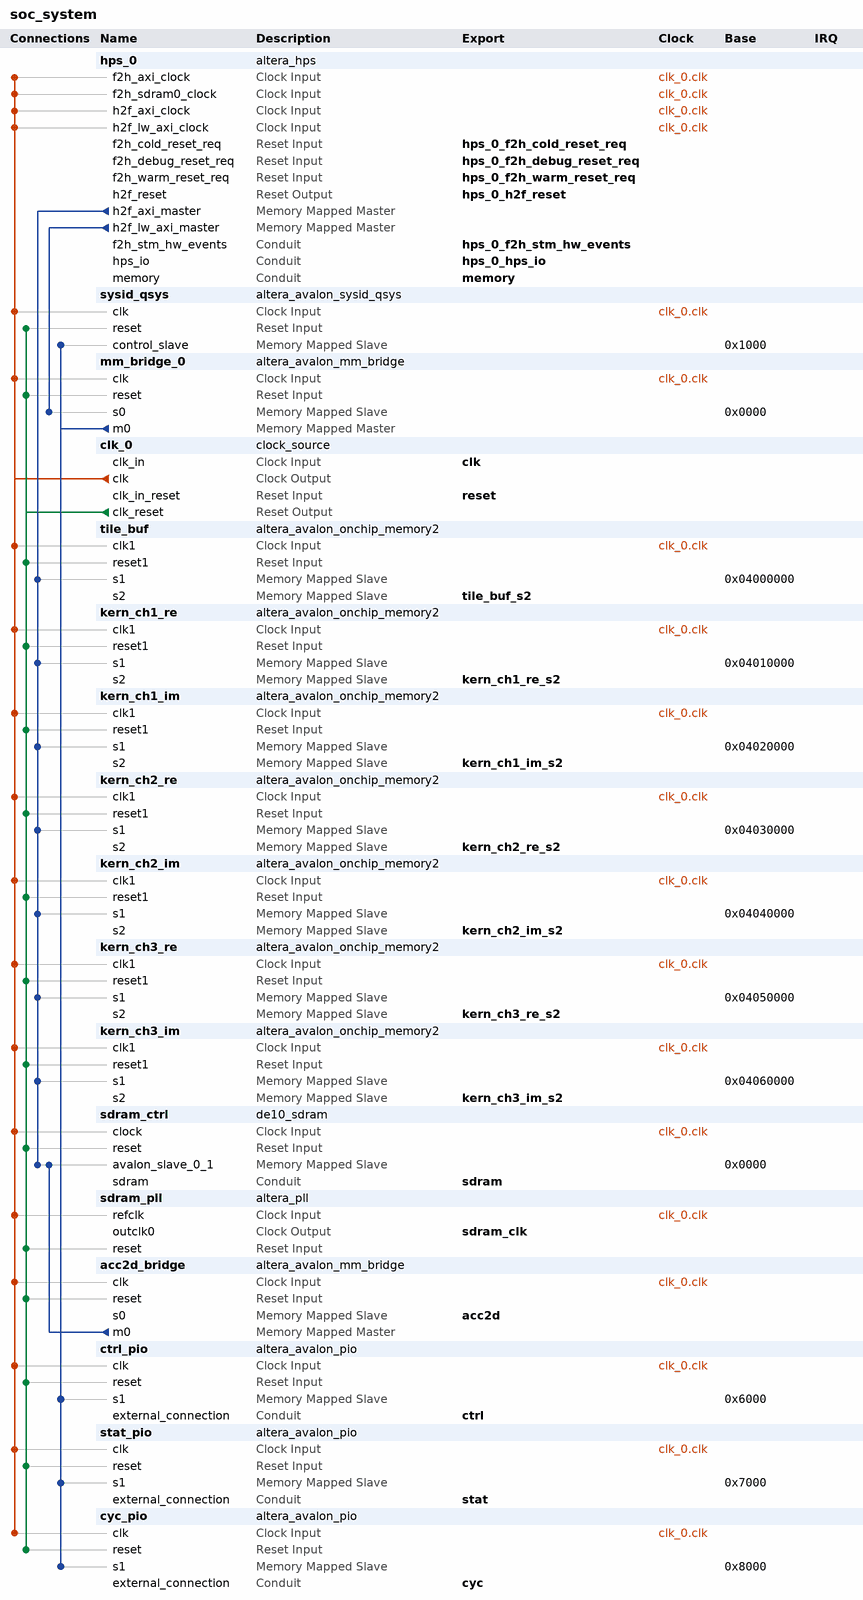
[diagram p0: system contents]
# Platform Designer (Qsys) system soc_system, Cyclone V 5CSXFC6D6F31C6
# Parameters at their usual value, and those the tool derives, are not listed.
package require -exact qsys 25.1
create_system soc_system
set_project_property DEVICE_FAMILY {Cyclone V}
set_project_property DEVICE 5CSXFC6D6F31C6

add_instance hps_0 altera_hps 25.1
set_instance_parameter_value hps_0 EMAC1_Mode RGMII
set_instance_parameter_value hps_0 EMAC1_PinMuxing {HPS I/O Set 0}
set_instance_parameter_value hps_0 F2SCLK_COLDRST_Enable true
set_instance_parameter_value hps_0 F2SCLK_DBGRST_Enable true
set_instance_parameter_value hps_0 F2SCLK_WARMRST_Enable true
set_instance_parameter_value hps_0 F2SDRAM_Type {Avalon-MM Bidirectional}
set_instance_parameter_value hps_0 F2SDRAM_Width 256
set_instance_parameter_value hps_0 F2SINTERRUPT_Enable true
set_instance_parameter_value hps_0 F2S_Width 2
set_instance_parameter_value hps_0 FPGA_PERIPHERAL_OUTPUT_CLOCK_FREQ_EMAC0_GTX_CLK 100
set_instance_parameter_value hps_0 FPGA_PERIPHERAL_OUTPUT_CLOCK_FREQ_EMAC0_MD_CLK 100.0
set_instance_parameter_value hps_0 FPGA_PERIPHERAL_OUTPUT_CLOCK_FREQ_EMAC1_GTX_CLK 100
set_instance_parameter_value hps_0 FPGA_PERIPHERAL_OUTPUT_CLOCK_FREQ_EMAC1_MD_CLK 100.0
set_instance_parameter_value hps_0 HPS_PROTOCOL DDR3
set_instance_parameter_value hps_0 I2C0_Mode I2C
set_instance_parameter_value hps_0 I2C0_PinMuxing {HPS I/O Set 0}
set_instance_parameter_value hps_0 I2C1_Mode I2C
set_instance_parameter_value hps_0 I2C1_PinMuxing {HPS I/O Set 0}
set_instance_parameter_value hps_0 LWH2F_Enable true
set_instance_parameter_value hps_0 MEM_BANKADDR_WIDTH 3
set_instance_parameter_value hps_0 MEM_CLK_FREQ 400.0
set_instance_parameter_value hps_0 MEM_COL_ADDR_WIDTH 10
set_instance_parameter_value hps_0 MEM_DQ_WIDTH 32
set_instance_parameter_value hps_0 MEM_DRV_STR RZQ/6
set_instance_parameter_value hps_0 MEM_ROW_ADDR_WIDTH 15
set_instance_parameter_value hps_0 MEM_RTT_NOM RZQ/6
set_instance_parameter_value hps_0 MEM_RTT_WR {Dynamic ODT off}
set_instance_parameter_value hps_0 MEM_TCL 11
set_instance_parameter_value hps_0 MEM_TFAW_NS 45.0
set_instance_parameter_value hps_0 MEM_TRAS_NS 35.0
set_instance_parameter_value hps_0 MEM_TRCD_NS 13.75
set_instance_parameter_value hps_0 MEM_TRFC_NS 260.0
set_instance_parameter_value hps_0 MEM_TRP_NS 13.75
set_instance_parameter_value hps_0 MEM_VENDOR Micron
set_instance_parameter_value hps_0 MEM_WTCL 7
set_instance_parameter_value hps_0 QSPI_Mode {1 SS}
set_instance_parameter_value hps_0 QSPI_PinMuxing {HPS I/O Set 0}
set_instance_parameter_value hps_0 REF_CLK_FREQ 25.0
set_instance_parameter_value hps_0 S2FCLK_USER2CLK 5
set_instance_parameter_value hps_0 S2F_Width 2
set_instance_parameter_value hps_0 SDIO_Mode {4-bit Data}
set_instance_parameter_value hps_0 SDIO_PinMuxing {HPS I/O Set 0}
set_instance_parameter_value hps_0 SPIM0_Mode {Single Slave Select}
set_instance_parameter_value hps_0 SPIM0_PinMuxing {HPS I/O Set 0}
set_instance_parameter_value hps_0 SPIM1_Mode {Single Slave Select}
set_instance_parameter_value hps_0 SPIM1_PinMuxing {HPS I/O Set 0}
set_instance_parameter_value hps_0 STM_Enable true
set_instance_parameter_value hps_0 TIMING_BOARD_AC_SKEW 0.02
set_instance_parameter_value hps_0 TIMING_BOARD_AC_TO_CK_SKEW 0.01
set_instance_parameter_value hps_0 TIMING_BOARD_DQ_TO_DQS_SKEW 0.05
set_instance_parameter_value hps_0 TIMING_BOARD_MAX_CK_DELAY 0.03
set_instance_parameter_value hps_0 TIMING_BOARD_MAX_DQS_DELAY 0.02
set_instance_parameter_value hps_0 TIMING_BOARD_SKEW_BETWEEN_DQS 0.06
set_instance_parameter_value hps_0 TIMING_BOARD_SKEW_CKDQS_DIMM_MAX 0.12
set_instance_parameter_value hps_0 TIMING_BOARD_SKEW_CKDQS_DIMM_MIN 0.06
set_instance_parameter_value hps_0 TIMING_BOARD_SKEW_WITHIN_DQS 0.01
set_instance_parameter_value hps_0 TIMING_TDH 65
set_instance_parameter_value hps_0 TIMING_TDQSCK 255
set_instance_parameter_value hps_0 TIMING_TDQSQ 125
set_instance_parameter_value hps_0 TIMING_TDS 30
set_instance_parameter_value hps_0 TIMING_TIH 140
set_instance_parameter_value hps_0 TIMING_TIS 190
set_instance_parameter_value hps_0 TIMING_TQSH 0.4
set_instance_parameter_value hps_0 UART0_Mode {No Flow Control}
set_instance_parameter_value hps_0 UART0_PinMuxing {HPS I/O Set 0}
set_instance_parameter_value hps_0 USB1_Mode SDR
set_instance_parameter_value hps_0 USB1_PinMuxing {HPS I/O Set 0}
set_instance_parameter_value hps_0 desired_cfg_clk_mhz 100.0
set_instance_parameter_value hps_0 desired_qspi_clk_mhz 400.0

add_instance sysid_qsys altera_avalon_sysid_qsys 25.1
set_instance_parameter_value sysid_qsys id -1395322110

add_instance mm_bridge_0 altera_avalon_mm_bridge 25.1
set_instance_parameter_value mm_bridge_0 ADDRESS_UNITS SYMBOLS
set_instance_parameter_value mm_bridge_0 ADDRESS_WIDTH 10
set_instance_parameter_value mm_bridge_0 DATA_WIDTH 32
set_instance_parameter_value mm_bridge_0 MAX_PENDING_RESPONSES 4
set_instance_parameter_value mm_bridge_0 USE_AUTO_ADDRESS_WIDTH 1

add_instance clk_0 clock_source 25.1
set_instance_parameter_value clk_0 clockFrequency 50000000

add_instance tile_buf altera_avalon_onchip_memory2 25.1
set_instance_parameter_value tile_buf dataWidth 8
set_instance_parameter_value tile_buf dualPort true
set_instance_parameter_value tile_buf initMemContent false
set_instance_parameter_value tile_buf initializationFileName onchip_mem.hex
set_instance_parameter_value tile_buf memorySize 12288
set_instance_parameter_value tile_buf singleClockOperation true

add_instance kern_ch1_re altera_avalon_onchip_memory2 25.1
set_instance_parameter_value kern_ch1_re dataWidth 16
set_instance_parameter_value kern_ch1_re dualPort true
set_instance_parameter_value kern_ch1_re initMemContent false
set_instance_parameter_value kern_ch1_re initializationFileName onchip_mem.hex
set_instance_parameter_value kern_ch1_re memorySize 33280
set_instance_parameter_value kern_ch1_re singleClockOperation true

add_instance kern_ch1_im altera_avalon_onchip_memory2 25.1
set_instance_parameter_value kern_ch1_im dataWidth 16
set_instance_parameter_value kern_ch1_im dualPort true
set_instance_parameter_value kern_ch1_im initMemContent false
set_instance_parameter_value kern_ch1_im initializationFileName onchip_mem.hex
set_instance_parameter_value kern_ch1_im memorySize 33280
set_instance_parameter_value kern_ch1_im singleClockOperation true

add_instance kern_ch2_re altera_avalon_onchip_memory2 25.1
set_instance_parameter_value kern_ch2_re dataWidth 16
set_instance_parameter_value kern_ch2_re dualPort true
set_instance_parameter_value kern_ch2_re initMemContent false
set_instance_parameter_value kern_ch2_re initializationFileName onchip_mem.hex
set_instance_parameter_value kern_ch2_re memorySize 33280
set_instance_parameter_value kern_ch2_re singleClockOperation true

add_instance kern_ch2_im altera_avalon_onchip_memory2 25.1
set_instance_parameter_value kern_ch2_im dataWidth 16
set_instance_parameter_value kern_ch2_im dualPort true
set_instance_parameter_value kern_ch2_im initMemContent false
set_instance_parameter_value kern_ch2_im initializationFileName onchip_mem.hex
set_instance_parameter_value kern_ch2_im memorySize 33280
set_instance_parameter_value kern_ch2_im singleClockOperation true

add_instance kern_ch3_re altera_avalon_onchip_memory2 25.1
set_instance_parameter_value kern_ch3_re dataWidth 16
set_instance_parameter_value kern_ch3_re dualPort true
set_instance_parameter_value kern_ch3_re initMemContent false
set_instance_parameter_value kern_ch3_re initializationFileName onchip_mem.hex
set_instance_parameter_value kern_ch3_re memorySize 33280
set_instance_parameter_value kern_ch3_re singleClockOperation true

add_instance kern_ch3_im altera_avalon_onchip_memory2 25.1
set_instance_parameter_value kern_ch3_im dataWidth 16
set_instance_parameter_value kern_ch3_im dualPort true
set_instance_parameter_value kern_ch3_im initMemContent false
set_instance_parameter_value kern_ch3_im initializationFileName onchip_mem.hex
set_instance_parameter_value kern_ch3_im memorySize 33280
set_instance_parameter_value kern_ch3_im singleClockOperation true

add_instance sdram_ctrl de10_sdram 1.0

add_instance sdram_pll altera_pll 25.1
set_instance_parameter_value sdram_pll gui_device_speed_grade 1
set_instance_parameter_value sdram_pll gui_number_of_clocks 1
set_instance_parameter_value sdram_pll gui_operation_mode direct
set_instance_parameter_value sdram_pll gui_output_clock_frequency0 50.0
set_instance_parameter_value sdram_pll gui_phase_shift0 -3750
set_instance_parameter_value sdram_pll gui_pll_mode {Integer-N PLL}
set_instance_parameter_value sdram_pll gui_reference_clock_frequency 50.0
set_instance_parameter_value sdram_pll gui_use_locked false

add_instance acc2d_bridge altera_avalon_mm_bridge 25.1
set_instance_parameter_value acc2d_bridge ADDRESS_UNITS SYMBOLS
set_instance_parameter_value acc2d_bridge ADDRESS_WIDTH 26
set_instance_parameter_value acc2d_bridge DATA_WIDTH 32
set_instance_parameter_value acc2d_bridge MAX_PENDING_RESPONSES 4
set_instance_parameter_value acc2d_bridge USE_AUTO_ADDRESS_WIDTH 0

add_instance ctrl_pio altera_avalon_pio 25.1
set_instance_parameter_value ctrl_pio direction Output
set_instance_parameter_value ctrl_pio width 1

add_instance stat_pio altera_avalon_pio 25.1
set_instance_parameter_value stat_pio bitClearingEdgeCapReg true
set_instance_parameter_value stat_pio captureEdge true
set_instance_parameter_value stat_pio direction Input
set_instance_parameter_value stat_pio width 2

add_instance cyc_pio altera_avalon_pio 25.1
set_instance_parameter_value cyc_pio direction Input
set_instance_parameter_value cyc_pio width 32

# connections
add_connection clk_0.clk acc2d_bridge.clk clock
add_connection clk_0.clk ctrl_pio.clk clock
add_connection clk_0.clk cyc_pio.clk clock
add_connection clk_0.clk hps_0.f2h_axi_clock clock
add_connection clk_0.clk hps_0.f2h_sdram0_clock clock
add_connection clk_0.clk hps_0.h2f_axi_clock clock
add_connection clk_0.clk hps_0.h2f_lw_axi_clock clock
add_connection clk_0.clk kern_ch1_im.clk1 clock
add_connection clk_0.clk kern_ch1_re.clk1 clock
add_connection clk_0.clk kern_ch2_im.clk1 clock
add_connection clk_0.clk kern_ch2_re.clk1 clock
add_connection clk_0.clk kern_ch3_im.clk1 clock
add_connection clk_0.clk kern_ch3_re.clk1 clock
add_connection clk_0.clk mm_bridge_0.clk clock
add_connection clk_0.clk sdram_ctrl.clock clock
add_connection clk_0.clk sdram_pll.refclk clock
add_connection clk_0.clk stat_pio.clk clock
add_connection clk_0.clk sysid_qsys.clk clock
add_connection clk_0.clk tile_buf.clk1 clock
add_connection clk_0.clk_reset acc2d_bridge.reset reset
add_connection clk_0.clk_reset ctrl_pio.reset reset
add_connection clk_0.clk_reset cyc_pio.reset reset
add_connection clk_0.clk_reset kern_ch1_im.reset1 reset
add_connection clk_0.clk_reset kern_ch1_re.reset1 reset
add_connection clk_0.clk_reset kern_ch2_im.reset1 reset
add_connection clk_0.clk_reset kern_ch2_re.reset1 reset
add_connection clk_0.clk_reset kern_ch3_im.reset1 reset
add_connection clk_0.clk_reset kern_ch3_re.reset1 reset
add_connection clk_0.clk_reset mm_bridge_0.reset reset
add_connection clk_0.clk_reset sdram_ctrl.reset reset
add_connection clk_0.clk_reset sdram_pll.reset reset
add_connection clk_0.clk_reset stat_pio.reset reset
add_connection clk_0.clk_reset sysid_qsys.reset reset
add_connection clk_0.clk_reset tile_buf.reset1 reset
add_connection acc2d_bridge.m0 sdram_ctrl.avalon_slave_0_1 avalon
set_connection_parameter_value acc2d_bridge.m0/sdram_ctrl.avalon_slave_0_1 baseAddress 0x0000
add_connection hps_0.h2f_axi_master kern_ch1_im.s1 avalon
set_connection_parameter_value hps_0.h2f_axi_master/kern_ch1_im.s1 baseAddress 0x04020000
add_connection hps_0.h2f_axi_master kern_ch1_re.s1 avalon
set_connection_parameter_value hps_0.h2f_axi_master/kern_ch1_re.s1 baseAddress 0x04010000
add_connection hps_0.h2f_axi_master kern_ch2_im.s1 avalon
set_connection_parameter_value hps_0.h2f_axi_master/kern_ch2_im.s1 baseAddress 0x04040000
add_connection hps_0.h2f_axi_master kern_ch2_re.s1 avalon
set_connection_parameter_value hps_0.h2f_axi_master/kern_ch2_re.s1 baseAddress 0x04030000
add_connection hps_0.h2f_axi_master kern_ch3_im.s1 avalon
set_connection_parameter_value hps_0.h2f_axi_master/kern_ch3_im.s1 baseAddress 0x04060000
add_connection hps_0.h2f_axi_master kern_ch3_re.s1 avalon
set_connection_parameter_value hps_0.h2f_axi_master/kern_ch3_re.s1 baseAddress 0x04050000
add_connection hps_0.h2f_axi_master sdram_ctrl.avalon_slave_0_1 avalon
set_connection_parameter_value hps_0.h2f_axi_master/sdram_ctrl.avalon_slave_0_1 baseAddress 0x0000
add_connection hps_0.h2f_axi_master tile_buf.s1 avalon
set_connection_parameter_value hps_0.h2f_axi_master/tile_buf.s1 baseAddress 0x04000000
add_connection hps_0.h2f_lw_axi_master mm_bridge_0.s0 avalon
set_connection_parameter_value hps_0.h2f_lw_axi_master/mm_bridge_0.s0 baseAddress 0x0000
add_connection mm_bridge_0.m0 ctrl_pio.s1 avalon
set_connection_parameter_value mm_bridge_0.m0/ctrl_pio.s1 baseAddress 0x6000
add_connection mm_bridge_0.m0 cyc_pio.s1 avalon
set_connection_parameter_value mm_bridge_0.m0/cyc_pio.s1 baseAddress 0x8000
add_connection mm_bridge_0.m0 stat_pio.s1 avalon
set_connection_parameter_value mm_bridge_0.m0/stat_pio.s1 baseAddress 0x7000
add_connection mm_bridge_0.m0 sysid_qsys.control_slave avalon
set_connection_parameter_value mm_bridge_0.m0/sysid_qsys.control_slave baseAddress 0x1000

# exported interfaces
add_interface acc2d avalon slave
set_interface_property acc2d EXPORT_OF acc2d_bridge.s0
add_interface clk clock sink
set_interface_property clk EXPORT_OF clk_0.clk_in
add_interface ctrl conduit end
set_interface_property ctrl EXPORT_OF ctrl_pio.external_connection
add_interface cyc conduit end
set_interface_property cyc EXPORT_OF cyc_pio.external_connection
add_interface hps_0_f2h_cold_reset_req reset sink
set_interface_property hps_0_f2h_cold_reset_req EXPORT_OF hps_0.f2h_cold_reset_req
add_interface hps_0_f2h_debug_reset_req reset sink
set_interface_property hps_0_f2h_debug_reset_req EXPORT_OF hps_0.f2h_debug_reset_req
add_interface hps_0_f2h_stm_hw_events conduit end
set_interface_property hps_0_f2h_stm_hw_events EXPORT_OF hps_0.f2h_stm_hw_events
add_interface hps_0_f2h_warm_reset_req reset sink
set_interface_property hps_0_f2h_warm_reset_req EXPORT_OF hps_0.f2h_warm_reset_req
add_interface hps_0_h2f_reset reset source
set_interface_property hps_0_h2f_reset EXPORT_OF hps_0.h2f_reset
add_interface hps_0_hps_io conduit end
set_interface_property hps_0_hps_io EXPORT_OF hps_0.hps_io
add_interface kern_ch1_im_s2 avalon slave
set_interface_property kern_ch1_im_s2 EXPORT_OF kern_ch1_im.s2
add_interface kern_ch1_re_s2 avalon slave
set_interface_property kern_ch1_re_s2 EXPORT_OF kern_ch1_re.s2
add_interface kern_ch2_im_s2 avalon slave
set_interface_property kern_ch2_im_s2 EXPORT_OF kern_ch2_im.s2
add_interface kern_ch2_re_s2 avalon slave
set_interface_property kern_ch2_re_s2 EXPORT_OF kern_ch2_re.s2
add_interface kern_ch3_im_s2 avalon slave
set_interface_property kern_ch3_im_s2 EXPORT_OF kern_ch3_im.s2
add_interface kern_ch3_re_s2 avalon slave
set_interface_property kern_ch3_re_s2 EXPORT_OF kern_ch3_re.s2
add_interface memory conduit end
set_interface_property memory EXPORT_OF hps_0.memory
add_interface reset reset sink
set_interface_property reset EXPORT_OF clk_0.clk_in_reset
add_interface sdram conduit end
set_interface_property sdram EXPORT_OF sdram_ctrl.sdram
add_interface sdram_clk clock source
set_interface_property sdram_clk EXPORT_OF sdram_pll.outclk0
add_interface stat conduit end
set_interface_property stat EXPORT_OF stat_pio.external_connection
add_interface tile_buf_s2 avalon slave
set_interface_property tile_buf_s2 EXPORT_OF tile_buf.s2

set_interconnect_requirement {$system} qsys_mm.clockCrossingAdapter HANDSHAKE
set_interconnect_requirement {$system} qsys_mm.maxAdditionalLatency 1

save_system soc_system.qsys
